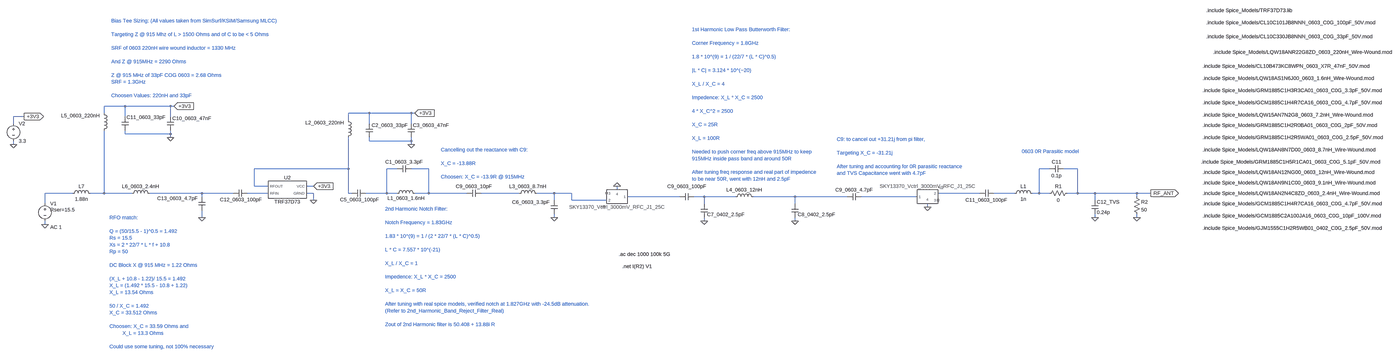
[diagram p0: schematic TX_Front_End_Real.asc, whole sheet]
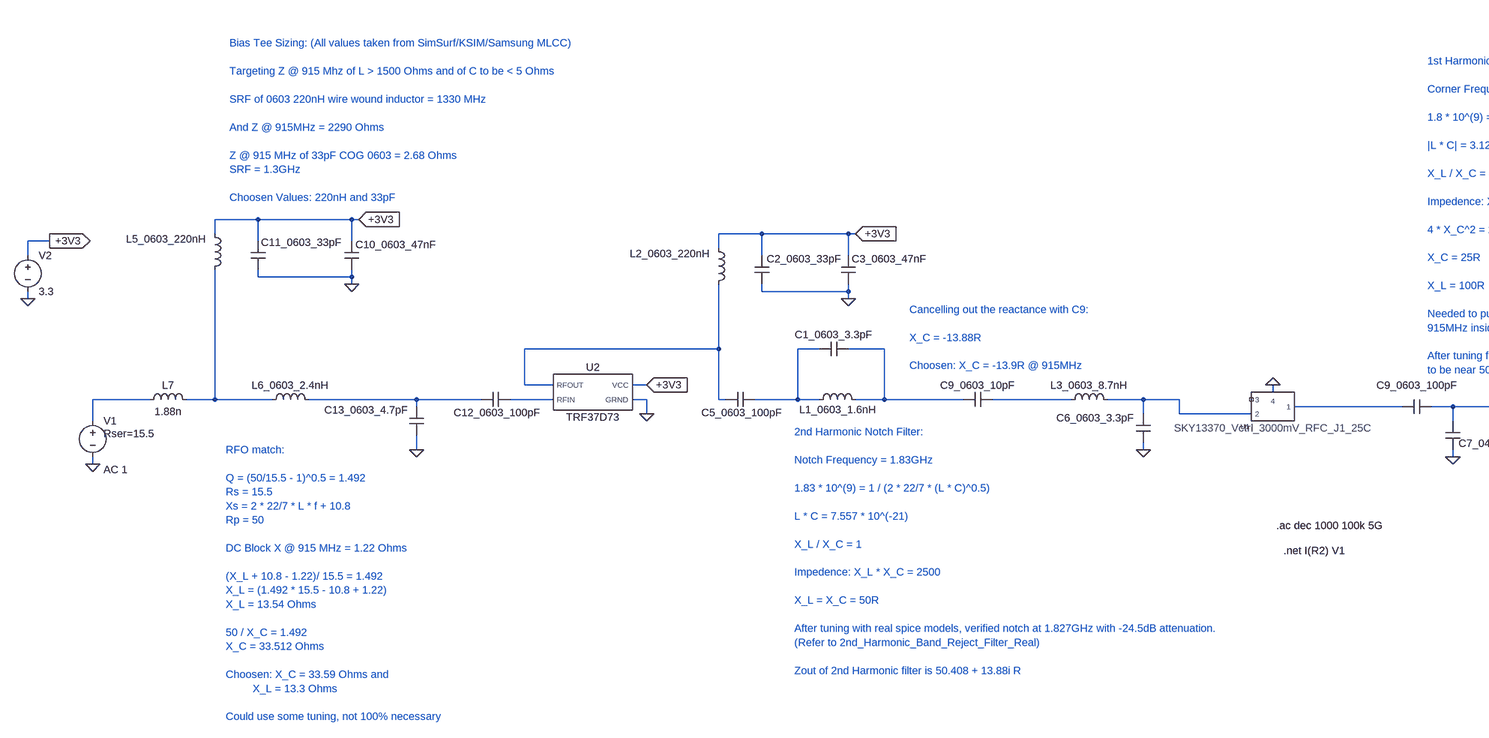
[diagram p1: schematic TX_Front_End_Real.asc, part, row 1 of 1, column 1 of 2]
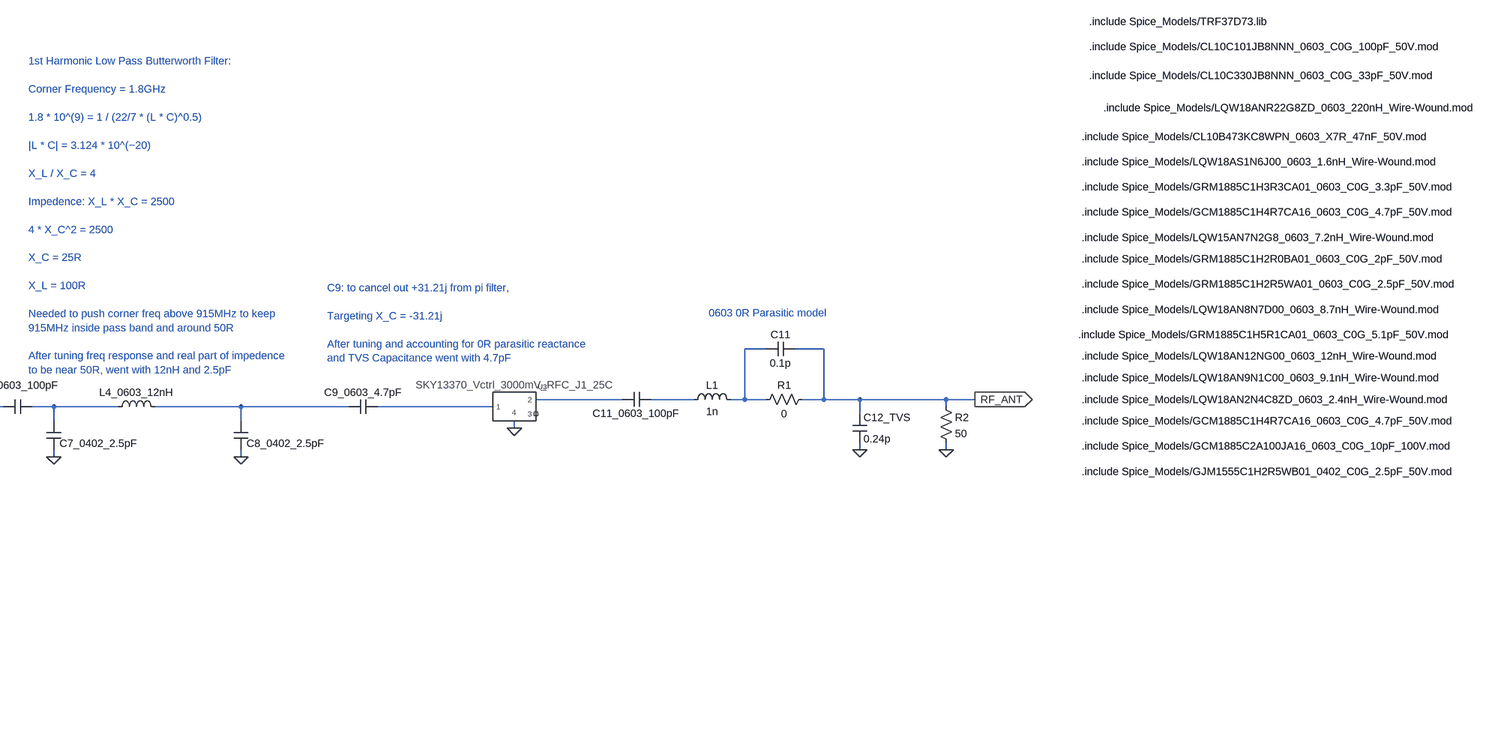
[diagram p2: schematic TX_Front_End_Real.asc, part, row 1 of 1, column 2 of 2]
TX_Front_End_Real.asc, the LTspice schematic file:
Version 4.1
SHEET 1 4856 1192
WIRE -1152 -272 -1248 -272
WIRE -944 -272 -1152 -272
WIRE -928 -272 -944 -272
WIRE -1248 -240 -1248 -272
WIRE -32 -240 -128 -240
WIRE 160 -240 -32 -240
WIRE 176 -240 160 -240
WIRE -1616 -224 -1664 -224
WIRE -1152 -224 -1152 -272
WIRE -944 -224 -944 -272
WIRE -128 -208 -128 -240
WIRE -1664 -192 -1664 -224
WIRE -32 -192 -32 -240
WIRE 160 -192 160 -240
WIRE -1152 -144 -1152 -160
WIRE -944 -144 -944 -160
WIRE -944 -144 -1152 -144
WIRE -944 -128 -944 -144
WIRE -32 -112 -32 -128
WIRE 160 -112 160 -128
WIRE 160 -112 -32 -112
WIRE -1664 -96 -1664 -112
WIRE 160 -96 160 -112
WIRE -128 16 -128 -128
WIRE -128 16 -560 16
WIRE 96 16 48 16
WIRE 240 16 160 16
WIRE 3088 16 3040 16
WIRE 3216 16 3152 16
WIRE -560 96 -560 16
WIRE -496 96 -560 96
WIRE -288 96 -320 96
WIRE 1104 112 1104 96
WIRE -1392 128 -1520 128
WIRE -1248 128 -1248 -160
WIRE -1248 128 -1312 128
WIRE -1120 128 -1248 128
WIRE -800 128 -1040 128
WIRE -656 128 -800 128
WIRE -496 128 -592 128
WIRE -288 128 -320 128
WIRE -128 128 -128 16
WIRE -112 128 -128 128
WIRE 48 128 48 16
WIRE 48 128 -48 128
WIRE 96 128 48 128
WIRE 240 128 240 16
WIRE 240 128 176 128
WIRE 416 128 240 128
WIRE 656 128 480 128
WIRE 816 128 736 128
WIRE 896 128 816 128
WIRE 2768 128 2576 128
WIRE 2928 128 2832 128
WIRE 3040 128 3040 16
WIRE 3040 128 3008 128
WIRE 3088 128 3040 128
WIRE 3216 128 3216 16
WIRE 3216 128 3168 128
WIRE 3296 128 3216 128
WIRE 3488 128 3296 128
WIRE 3552 128 3488 128
WIRE -800 144 -800 128
WIRE 1392 144 1152 144
WIRE 1504 144 1456 144
WIRE 1648 144 1504 144
WIRE 1920 144 1728 144
WIRE 2160 144 1920 144
WIRE 2480 144 2224 144
WIRE 3488 144 3488 128
WIRE -288 160 -288 128
WIRE 816 160 816 128
WIRE 896 160 896 128
WIRE 1056 160 896 160
WIRE 3296 160 3296 128
WIRE -1520 176 -1520 128
WIRE 1504 176 1504 144
WIRE 1920 176 1920 144
WIRE 2528 192 2528 176
WIRE -800 240 -800 208
WIRE 816 240 816 224
WIRE 3296 240 3296 224
WIRE 3488 240 3488 224
WIRE 1504 256 1504 240
WIRE 1920 256 1920 240
WIRE -1520 272 -1520 256
FLAG 176 -240 +3V3
IOPIN 176 -240 In
FLAG 160 -96 0
FLAG 816 240 0
FLAG 1504 256 0
FLAG 1920 256 0
FLAG 3552 128 RF_ANT
IOPIN 3552 128 Out
FLAG -1520 272 0
FLAG 3488 240 0
FLAG 1104 96 0
FLAG -288 160 0
FLAG -944 -128 0
FLAG -800 240 0
FLAG -288 96 +3V3
IOPIN -288 96 In
FLAG -1664 -96 0
FLAG -1616 -224 +3V3
IOPIN -1616 -224 Out
FLAG -928 -272 +3V3
IOPIN -928 -272 In
FLAG 3296 240 0
FLAG 2528 192 0
SYMBOL ind 80 144 R270
WINDOW 0 -22 57 VTop 2
WINDOW 3 5 56 Invisible 2
SYMATTR InstName L1_0603_1.6nH
SYMATTR Value LQW18AS1N6J00
SYMATTR Prefix X
SYMBOL cap 160 0 R90
WINDOW 0 0 32 VBottom 2
WINDOW 3 32 32 Invisible 2
SYMATTR InstName C1_0603_3.3pF
SYMATTR Value GRM1885C1H3R3CA01_DC0V_25degC
SYMATTR Prefix X
SYMBOL ind -144 -224 R0
WINDOW 0 -182 28 Left 2
WINDOW 3 36 80 Invisible 2
SYMATTR InstName L2_0603_220nH
SYMATTR Value LQW18ANR22G8Z
SYMATTR Prefix X
SYMBOL cap 144 -192 R0
WINDOW 3 24 56 Invisible 2
SYMATTR Value CL10B473KC8WPN_Precise_DC3.3V_25degC
SYMATTR InstName C3_0603_47nF
SYMATTR Prefix X
SYMBOL ind 640 144 R270
WINDOW 0 32 56 VTop 2
WINDOW 3 5 56 Invisible 2
SYMATTR InstName L3_0603_8.7nH
SYMATTR Value LQW18AN8N7D00
SYMATTR Prefix X
SYMBOL cap -48 112 R90
WINDOW 0 61 28 VBottom 2
WINDOW 3 32 32 Invisible 2
SYMATTR InstName C5_0603_100pF
SYMATTR Value CL10C101JB8NNN_Precise_DC0V_25degC
SYMATTR Prefix X
SYMBOL cap 800 160 R0
WINDOW 0 -177 9 Left 2
WINDOW 3 24 56 Invisible 2
SYMATTR InstName C6_0603_3.3pF
SYMATTR Value GRM1885C1H3R3CA01_DC0V_25degC
SYMATTR Prefix X
SYMBOL ind 1632 160 R270
WINDOW 0 32 56 VTop 2
WINDOW 3 5 56 Invisible 2
SYMATTR InstName L4_0603_12nH
SYMATTR Value LQW18AN12NG00
SYMATTR Prefix X
SYMBOL voltage -1520 160 R0
WINDOW 123 24 124 Left 2
WINDOW 39 24 44 Left 2
SYMATTR Value2 AC 1
SYMATTR SpiceLine Rser=15.5
SYMATTR InstName V1
SYMATTR Value ""
SYMBOL cap 1488 176 R0
WINDOW 0 29 50 Left 2
WINDOW 3 24 56 Invisible 2
SYMATTR InstName C7_0402_2.5pF
SYMATTR Value GJM1555C1H2R5WB01_DC0V_25degC
SYMATTR Prefix X
SYMBOL res 3472 128 R0
SYMATTR InstName R2
SYMATTR Value 50
SYMBOL cap 480 112 R90
WINDOW 0 0 32 VBottom 2
WINDOW 3 32 32 Invisible 2
SYMATTR InstName C9_0603_10pF
SYMATTR Value GCM1885C2A100JA16_DC0V_25degC
SYMATTR Prefix X
SYMBOL SKY13370_Vctrl_3000mV_RFC_J1_25C 1104 144 R180
SYMATTR InstName U1
SYMBOL cap -16 -128 R180
WINDOW 0 -162 56 Left 2
WINDOW 3 24 8 Invisible 2
SYMATTR InstName C2_0603_33pF
SYMATTR Value CL10C330JB8NNN_Precise_DC0V_25degC
SYMATTR Prefix X
SYMBOL Spice_Models\\TRF37D73 -416 112 R0
SYMATTR InstName U2
SYMBOL ind -1264 -256 R0
WINDOW 0 -182 28 Left 2
WINDOW 3 36 80 Invisible 2
SYMATTR InstName L5_0603_220nH
SYMATTR Value LQW18ANR22G8Z
SYMATTR Prefix X
SYMBOL cap -960 -224 R0
WINDOW 3 24 56 Invisible 2
SYMATTR Value CL10B473KC8WPN_Precise_DC3.3V_25degC
SYMATTR InstName C10_0603_47nF
SYMATTR Prefix X
SYMBOL cap -1136 -160 R180
WINDOW 0 -171 61 Left 2
WINDOW 3 24 8 Invisible 2
SYMATTR InstName C11_0603_33pF
SYMATTR Value CL10C330JB8NNN_Precise_DC0V_25degC
SYMATTR Prefix X
SYMBOL cap -592 112 R90
WINDOW 0 61 28 VBottom 2
WINDOW 3 32 32 Invisible 2
SYMATTR InstName C12_0603_100pF
SYMATTR Value CL10C101JB8NNN_Precise_DC0V_25degC
SYMATTR Prefix X
SYMBOL cap -816 144 R0
WINDOW 0 -189 8 Left 2
WINDOW 3 24 56 Invisible 2
SYMATTR InstName C13_0603_4.7pF
SYMATTR Value GCM1885C1H4R7CA16_DC0V_25degC
SYMATTR Prefix X
SYMBOL ind -1136 144 R270
WINDOW 0 32 56 VTop 2
WINDOW 3 5 56 Invisible 2
SYMATTR InstName L6_0603_2.4nH
SYMATTR Value LQW18AN2N4C8Z
SYMATTR Prefix X
SYMBOL ind -1408 144 R270
WINDOW 0 32 56 VTop 2
WINDOW 3 5 56 VBottom 2
SYMATTR InstName L7
SYMATTR Value 1.88n
SYMATTR SpiceLine Rser=1m
SYMBOL voltage -1664 -208 R0
WINDOW 123 0 0 Left 0
WINDOW 39 0 0 Left 0
SYMATTR InstName V2
SYMATTR Value 3.3
SYMBOL cap 1904 176 R0
WINDOW 0 29 50 Left 2
WINDOW 3 24 56 Invisible 2
SYMATTR InstName C8_0402_2.5pF
SYMATTR Value GJM1555C1H2R5WB01_DC0V_25degC
SYMATTR Prefix X
SYMBOL cap 2224 128 R90
WINDOW 0 0 32 VBottom 2
WINDOW 3 32 32 Invisible 2
SYMATTR InstName C9_0603_4.7pF
SYMATTR Value GCM1885C1H4R7CA16_DC0V_25degC
SYMATTR Prefix X
SYMBOL cap 3280 160 R0
SYMATTR InstName C12_TVS
SYMATTR Value 0.24p
SYMBOL SKY13370_Vctrl_3000mV_RFC_J1_25C 2528 144 R0
SYMATTR InstName U3
SYMBOL cap 3088 32 R270
WINDOW 0 32 32 VTop 2
WINDOW 3 0 32 VBottom 2
SYMATTR InstName C11
SYMATTR Value 0.1p
SYMBOL ind 2912 144 R270
WINDOW 0 32 56 VTop 2
WINDOW 3 5 56 VBottom 2
SYMATTR InstName L1
SYMATTR Value 1n
SYMATTR SpiceLine Rser=0
SYMBOL res 3184 112 R90
WINDOW 0 0 56 VBottom 2
WINDOW 3 32 56 VTop 2
SYMATTR InstName R1
SYMATTR Value 0
SYMBOL cap 1456 128 R90
WINDOW 0 -16 31 VBottom 2
WINDOW 3 32 32 Invisible 2
SYMATTR InstName C9_0603_100pF
SYMATTR Value CL10C101JB8NNN_Precise_DC0V_25degC
SYMATTR Prefix X
SYMBOL cap 2832 112 R90
WINDOW 0 63 33 VBottom 2
WINDOW 3 32 32 Invisible 2
SYMATTR InstName C11_0603_100pF
SYMATTR Value CL10C101JB8NNN_Precise_DC0V_25degC
SYMATTR Prefix X
TEXT 1112 408 Left 2 !.ac dec 1000 100k 5G
TEXT 1128 464 Left 2 !.net I(R2) V1
TEXT 3944 -592 Left 2 !.include Spice_Models/CL10C330JB8NNN_0603_C0G_33pF_50V.mod
TEXT 3976 -520 Left 2 !.include Spice_Models/LQW18ANR22G8ZD_0603_220nH_Wire-Wound.mod
TEXT 3928 -456 Left 2 !.include Spice_Models/CL10B473KC8WPN_0603_X7R_47nF_50V.mod
TEXT 3944 -656 Left 2 !.include Spice_Models/CL10C101JB8NNN_0603_C0G_100pF_50V.mod
TEXT 3928 -400 Left 2 !.include Spice_Models/LQW18AS1N6J00_0603_1.6nH_Wire-Wound.mod
TEXT 3928 -344 Left 2 !.include Spice_Models/GRM1885C1H3R3CA01_0603_C0G_3.3pF_50V.mod
TEXT 3928 -288 Left 2 !.include Spice_Models/GCM1885C1H4R7CA16_0603_C0G_4.7pF_50V.mod
TEXT 3928 -232 Left 2 !.include Spice_Models/LQW15AN7N2G8_0603_7.2nH_Wire-Wound.mod
TEXT 3928 -184 Left 2 !.include Spice_Models/GRM1885C1H2R0BA01_0603_C0G_2pF_50V.mod
TEXT 3928 -128 Left 2 !.include Spice_Models/GRM1885C1H2R5WA01_0603_C0G_2.5pF_50V.mod
TEXT 3928 -72 Left 2 !.include Spice_Models/LQW18AN8N7D00_0603_8.7nH_Wire-Wound.mod
TEXT 3920 -16 Left 2 !.include Spice_Models/GRM1885C1H5R1CA01_0603_C0G_5.1pF_50V.mod
TEXT 3928 32 Left 2 !.include Spice_Models/LQW18AN12NG00_0603_12nH_Wire-Wound.mod
TEXT 3928 80 Left 2 !.include Spice_Models/LQW18AN9N1C00_0603_9.1nH_Wire-Wound.mod
TEXT 3928 128 Left 2 !.include Spice_Models/LQW18AN2N4C8ZD_0603_2.4nH_Wire-Wound.mod
TEXT 3944 -712 Left 2 !.include Spice_Models/TRF37D73.lib
TEXT -1224 240 Left 2 ;RFO match:\n \nQ = (50/15.5 - 1)^0.5 = 1.492\nRs = 15.5\nXs = 2 * 22/7 * L * f + 10.8\nRp = 50\n \nDC Block X @ 915 MHz = 1.22 Ohms\n \n(X_L + 10.8 - 1.22)/ 15.5 = 1.492\nX_L = (1.492 * 15.5 - 10.8 + 1.22)\nX_L = 13.54 Ohms\n \n50 / X_C = 1.492\nX_C = 33.512 Ohms\n \nChoosen: X_C = 33.59 Ohms and \n         X_L = 13.3 Ohms\n \nCould use some tuning, not 100% necessary
TEXT -1216 -664 Left 2 ;Bias Tee Sizing: (All values taken from SimSurf/KSIM/Samsung MLCC)\n \nTargeting Z @ 915 Mhz of L > 1500 Ohms and of C to be < 5 Ohms\n \nSRF of 0603 220nH wire wound inductor = 1330 MHz\n \nAnd Z @ 915MHz = 2290 Ohms\n \nZ @ 915 MHz of 33pF COG 0603 = 2.68 Ohms\nSRF = 1.3GHz\n \nChoosen Values: 220nH and 33pF
TEXT 3928 176 Left 2 !.include Spice_Models/GCM1885C1H4R7CA16_0603_C0G_4.7pF_50V.mod
TEXT 40 200 Left 2 ;2nd Harmonic Notch Filter:\n \nNotch Frequency = 1.83GHz\n \n1.83 * 10^(9) = 1 / (2 * 22/7 * (L * C)^0.5)\n \nL * C = 7.557 * 10^(-21)\n \nX_L / X_C = 1\n \nImpedence: X_L * X_C = 2500\n \nX_L = X_C = 50R\n \nAfter tuning with real spice models, verified notch at 1.827GHz with -24.5dB attenuation.\n(Refer to 2nd_Harmonic_Band_Reject_Filter_Real)\n \nZout of 2nd Harmonic filter is 50.408 + 13.88i R
TEXT 3928 232 Left 2 !.include Spice_Models/GCM1885C2A100JA16_0603_C0G_10pF_100V.mod
TEXT 296 -72 Left 2 ;Cancelling out the reactance with C9:\n \nX_C = -13.88R\n \nChoosen: X_C = -13.9R @ 915MHz
TEXT 1448 -624 Left 2 ;1st Harmonic Low Pass Butterworth Filter:\n \nCorner Frequency = 1.8GHz\n \n1.8 * 10^(9) = 1 / (22/7 * (L * C)^0.5)\n \n|L * C| = 3.124 * 10^(−20)\n \nX_L / X_C = 4\n \nImpedence: X_L * X_C = 2500\n \n4 * X_C^2 = 2500\n \nX_C = 25R\n \nX_L = 100R\n \nNeeded to push corner freq above 915MHz to keep \n915MHz inside pass band and around 50R\n \nAfter tuning freq response and real part of impedence\nto be near 50R, went with 12nH and 2.5pF
TEXT 2112 -120 Left 2 ;C9: to cancel out +31.21j from pi filter,\n \nTargeting X_C = -31.21j\n \nAfter tuning and accounting for 0R parasitic reactance \nand TVS Capacitance went with 4.7pF
TEXT 3928 288 Left 2 !.include Spice_Models/GJM1555C1H2R5WB01_0402_C0G_2.5pF_50V.mod
TEXT 2960 -64 Left 2 ;0603 0R Parasitic model

The netlist it stands for:
* TX_Front_End_Real.asc
X§L1_0603_1.6nH N002 N003 LQW18AS1N6J00  ; pins A B
X§C1_0603_3.3pF N003 N002 GRM1885C1H3R3CA01_DC0V_25degC  ; pins A B
X§L2_0603_220nH +3V3 N001 LQW18ANR22G8Z  ; pins A B
X§C3_0603_47nF +3V3 0 CL10B473KC8WPN_Precise_DC3.3V_25degC  ; pins A B
X§L3_0603_8.7nH N009 N010 LQW18AN8N7D00  ; pins A B
X§C5_0603_100pF N002 N001 CL10C101JB8NNN_Precise_DC0V_25degC  ; pins A B
X§C6_0603_3.3pF N010 0 GRM1885C1H3R3CA01_DC0V_25degC  ; pins A B
X§L4_0603_12nH N014 N015 LQW18AN12NG00  ; pins A B
V1 N005 0 AC 1 Rser=15.5
X§C7_0402_2.5pF N014 0 GJM1555C1H2R5WB01_DC0V_25degC  ; pins A B
R2 RF_ANT 0 50
X§C9_0603_10pF N009 N003 GCM1885C2A100JA16_DC0V_25degC  ; pins A B
X§U1 N013 N010 NC_01 0 SKY13370_Vctrl_3000mV_RFC_J1_25C  ; pins 1 2 3 4
X§C2_0603_33pF 0 +3V3 CL10C330JB8NNN_Precise_DC0V_25degC  ; pins A B
X§U2 N001 N008 +3V3 0 TRF37D73  ; pins RFOUT RFIN VCC GRND
X§L5_0603_220nH +3V3 N006 LQW18ANR22G8Z  ; pins A B
X§C10_0603_47nF +3V3 0 CL10B473KC8WPN_Precise_DC3.3V_25degC  ; pins A B
X§C11_0603_33pF 0 +3V3 CL10C330JB8NNN_Precise_DC0V_25degC  ; pins A B
X§C12_0603_100pF N008 N007 CL10C101JB8NNN_Precise_DC0V_25degC  ; pins A B
X§C13_0603_4.7pF N007 0 GCM1885C1H4R7CA16_DC0V_25degC  ; pins A B
X§L6_0603_2.4nH N006 N007 LQW18AN2N4C8Z  ; pins A B
L7 N005 N006 1.88n Rser=1m
V2 +3V3 0 3.3
X§C8_0402_2.5pF N015 0 GJM1555C1H2R5WB01_DC0V_25degC  ; pins A B
X§C9_0603_4.7pF N016 N015 GCM1885C1H4R7CA16_DC0V_25degC  ; pins A B
C12_TVS RF_ANT 0 0.24p
X§U3 N016 N011 NC_02 0 SKY13370_Vctrl_3000mV_RFC_J1_25C  ; pins 1 2 3 4
C11 N004 RF_ANT 0.1p
L1 N012 N004 1n Rser=0
R1 RF_ANT N004 0
X§C9_0603_100pF N014 N013 CL10C101JB8NNN_Precise_DC0V_25degC  ; pins A B
X§C11_0603_100pF N012 N011 CL10C101JB8NNN_Precise_DC0V_25degC  ; pins A B
.ac dec 1000 100k 5G
.net I(R2) V1
.include Spice_Models/CL10C330JB8NNN_0603_C0G_33pF_50V.mod
.include Spice_Models/LQW18ANR22G8ZD_0603_220nH_Wire-Wound.mod
.include Spice_Models/CL10B473KC8WPN_0603_X7R_47nF_50V.mod
.include Spice_Models/CL10C101JB8NNN_0603_C0G_100pF_50V.mod
.include Spice_Models/LQW18AS1N6J00_0603_1.6nH_Wire-Wound.mod
.include Spice_Models/GRM1885C1H3R3CA01_0603_C0G_3.3pF_50V.mod
.include Spice_Models/GCM1885C1H4R7CA16_0603_C0G_4.7pF_50V.mod
.include Spice_Models/LQW15AN7N2G8_0603_7.2nH_Wire-Wound.mod
.include Spice_Models/GRM1885C1H2R0BA01_0603_C0G_2pF_50V.mod
.include Spice_Models/GRM1885C1H2R5WA01_0603_C0G_2.5pF_50V.mod
.include Spice_Models/LQW18AN8N7D00_0603_8.7nH_Wire-Wound.mod
.include Spice_Models/GRM1885C1H5R1CA01_0603_C0G_5.1pF_50V.mod
.include Spice_Models/LQW18AN12NG00_0603_12nH_Wire-Wound.mod
.include Spice_Models/LQW18AN9N1C00_0603_9.1nH_Wire-Wound.mod
.include Spice_Models/LQW18AN2N4C8ZD_0603_2.4nH_Wire-Wound.mod
.include Spice_Models/TRF37D73.lib
* RFO match:
* Q = (50/15.5 - 1)^0.5 = 1.492
* Rs = 15.5
* Xs = 2 * 22/7 * L * f + 10.8
* Rp = 50
* DC Block X @ 915 MHz = 1.22 Ohms
* (X_L + 10.8 - 1.22)/ 15.5 = 1.492
* X_L = (1.492 * 15.5 - 10.8 + 1.22)
* X_L = 13.54 Ohms
* 50 / X_C = 1.492
* X_C = 33.512 Ohms
* Choosen: X_C = 33.59 Ohms and
*          X_L = 13.3 Ohms
* Could use some tuning, not 100% necessary
* Bias Tee Sizing: (All values taken from SimSurf/KSIM/Samsung MLCC)
* Targeting Z @ 915 Mhz of L > 1500 Ohms and of C to be < 5 Ohms
* SRF of 0603 220nH wire wound inductor = 1330 MHz
* And Z @ 915MHz = 2290 Ohms
* Z @ 915 MHz of 33pF COG 0603 = 2.68 Ohms
* SRF = 1.3GHz
* Choosen Values: 220nH and 33pF
.include Spice_Models/GCM1885C1H4R7CA16_0603_C0G_4.7pF_50V.mod
* 2nd Harmonic Notch Filter:
* Notch Frequency = 1.83GHz
* 1.83 * 10^(9) = 1 / (2 * 22/7 * (L * C)^0.5)
* L * C = 7.557 * 10^(-21)
* X_L / X_C = 1
* Impedence: X_L * X_C = 2500
* X_L = X_C = 50R
* After tuning with real spice models, verified notch at 1.827GHz with -24.5dB attenuation.
* (Refer to 2nd_Harmonic_Band_Reject_Filter_Real)
* Zout of 2nd Harmonic filter is 50.408 + 13.88i R
.include Spice_Models/GCM1885C2A100JA16_0603_C0G_10pF_100V.mod
* Cancelling out the reactance with C9:
* X_C = -13.88R
* Choosen: X_C = -13.9R @ 915MHz
* 1st Harmonic Low Pass Butterworth Filter:
* Corner Frequency = 1.8GHz
* 1.8 * 10^(9) = 1 / (22/7 * (L * C)^0.5)
* |L * C| = 3.124 * 10^(−20)
* X_L / X_C = 4
* Impedence: X_L * X_C = 2500
* 4 * X_C^2 = 2500
* X_C = 25R
* X_L = 100R
* Needed to push corner freq above 915MHz to keep
* 915MHz inside pass band and around 50R
* After tuning freq response and real part of impedence
* to be near 50R, went with 12nH and 2.5pF
* C9: to cancel out +31.21j from pi filter,
* Targeting X_C = -31.21j
* After tuning and accounting for 0R parasitic reactance
* and TVS Capacitance went with 4.7pF
.include Spice_Models/GJM1555C1H2R5WB01_0402_C0G_2.5pF_50V.mod
* 0603 0R Parasitic model
.lib SKY13370_Vctrl_3000mV_RFC_J1_25C.inc
.backanno
.end